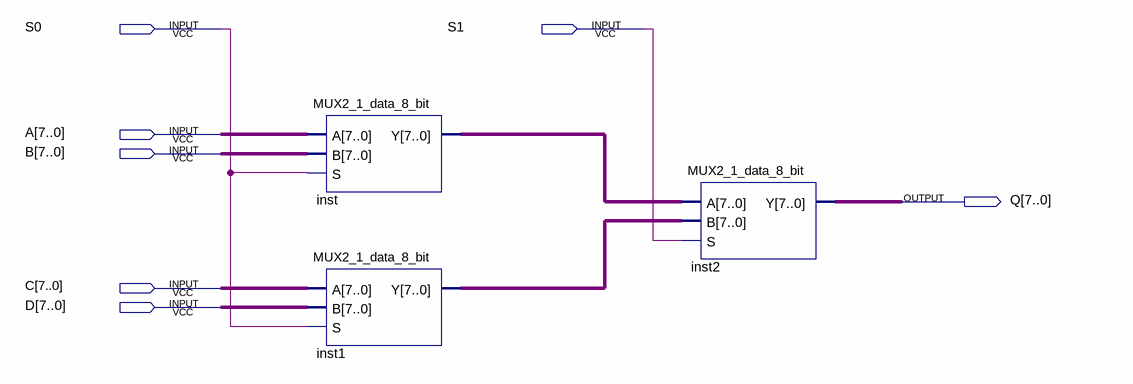
[diagram p0: schematic sheet]
// Quartus schematic MUX4_1_data_8_bit.bdf as structural Verilog: 3 symbols, 7 pins
module MUX4_1_data_8_bit (
  input  S0,
  input  S1,
  input  [7:0] A,
  input  [7:0] B,
  input  [7:0] C,
  input  [7:0] D,
  output [7:0] Q
);

  wire [7:0] inst1_y, inst_y;

  MUX2_1_data_8_bit inst (.A(A), .B(B), .S(S0), .Y(inst_y));
  MUX2_1_data_8_bit inst1 (.A(C), .B(D), .S(S0), .Y(inst1_y));
  MUX2_1_data_8_bit inst2 (.A(inst_y), .B(inst1_y), .S(S1), .Y(Q));
endmodule
